# Altium schematic sheet Connector-Sheet.SchDoc
size 420 x 297 mm; SheetNumber: 4; SheetTotal: 4
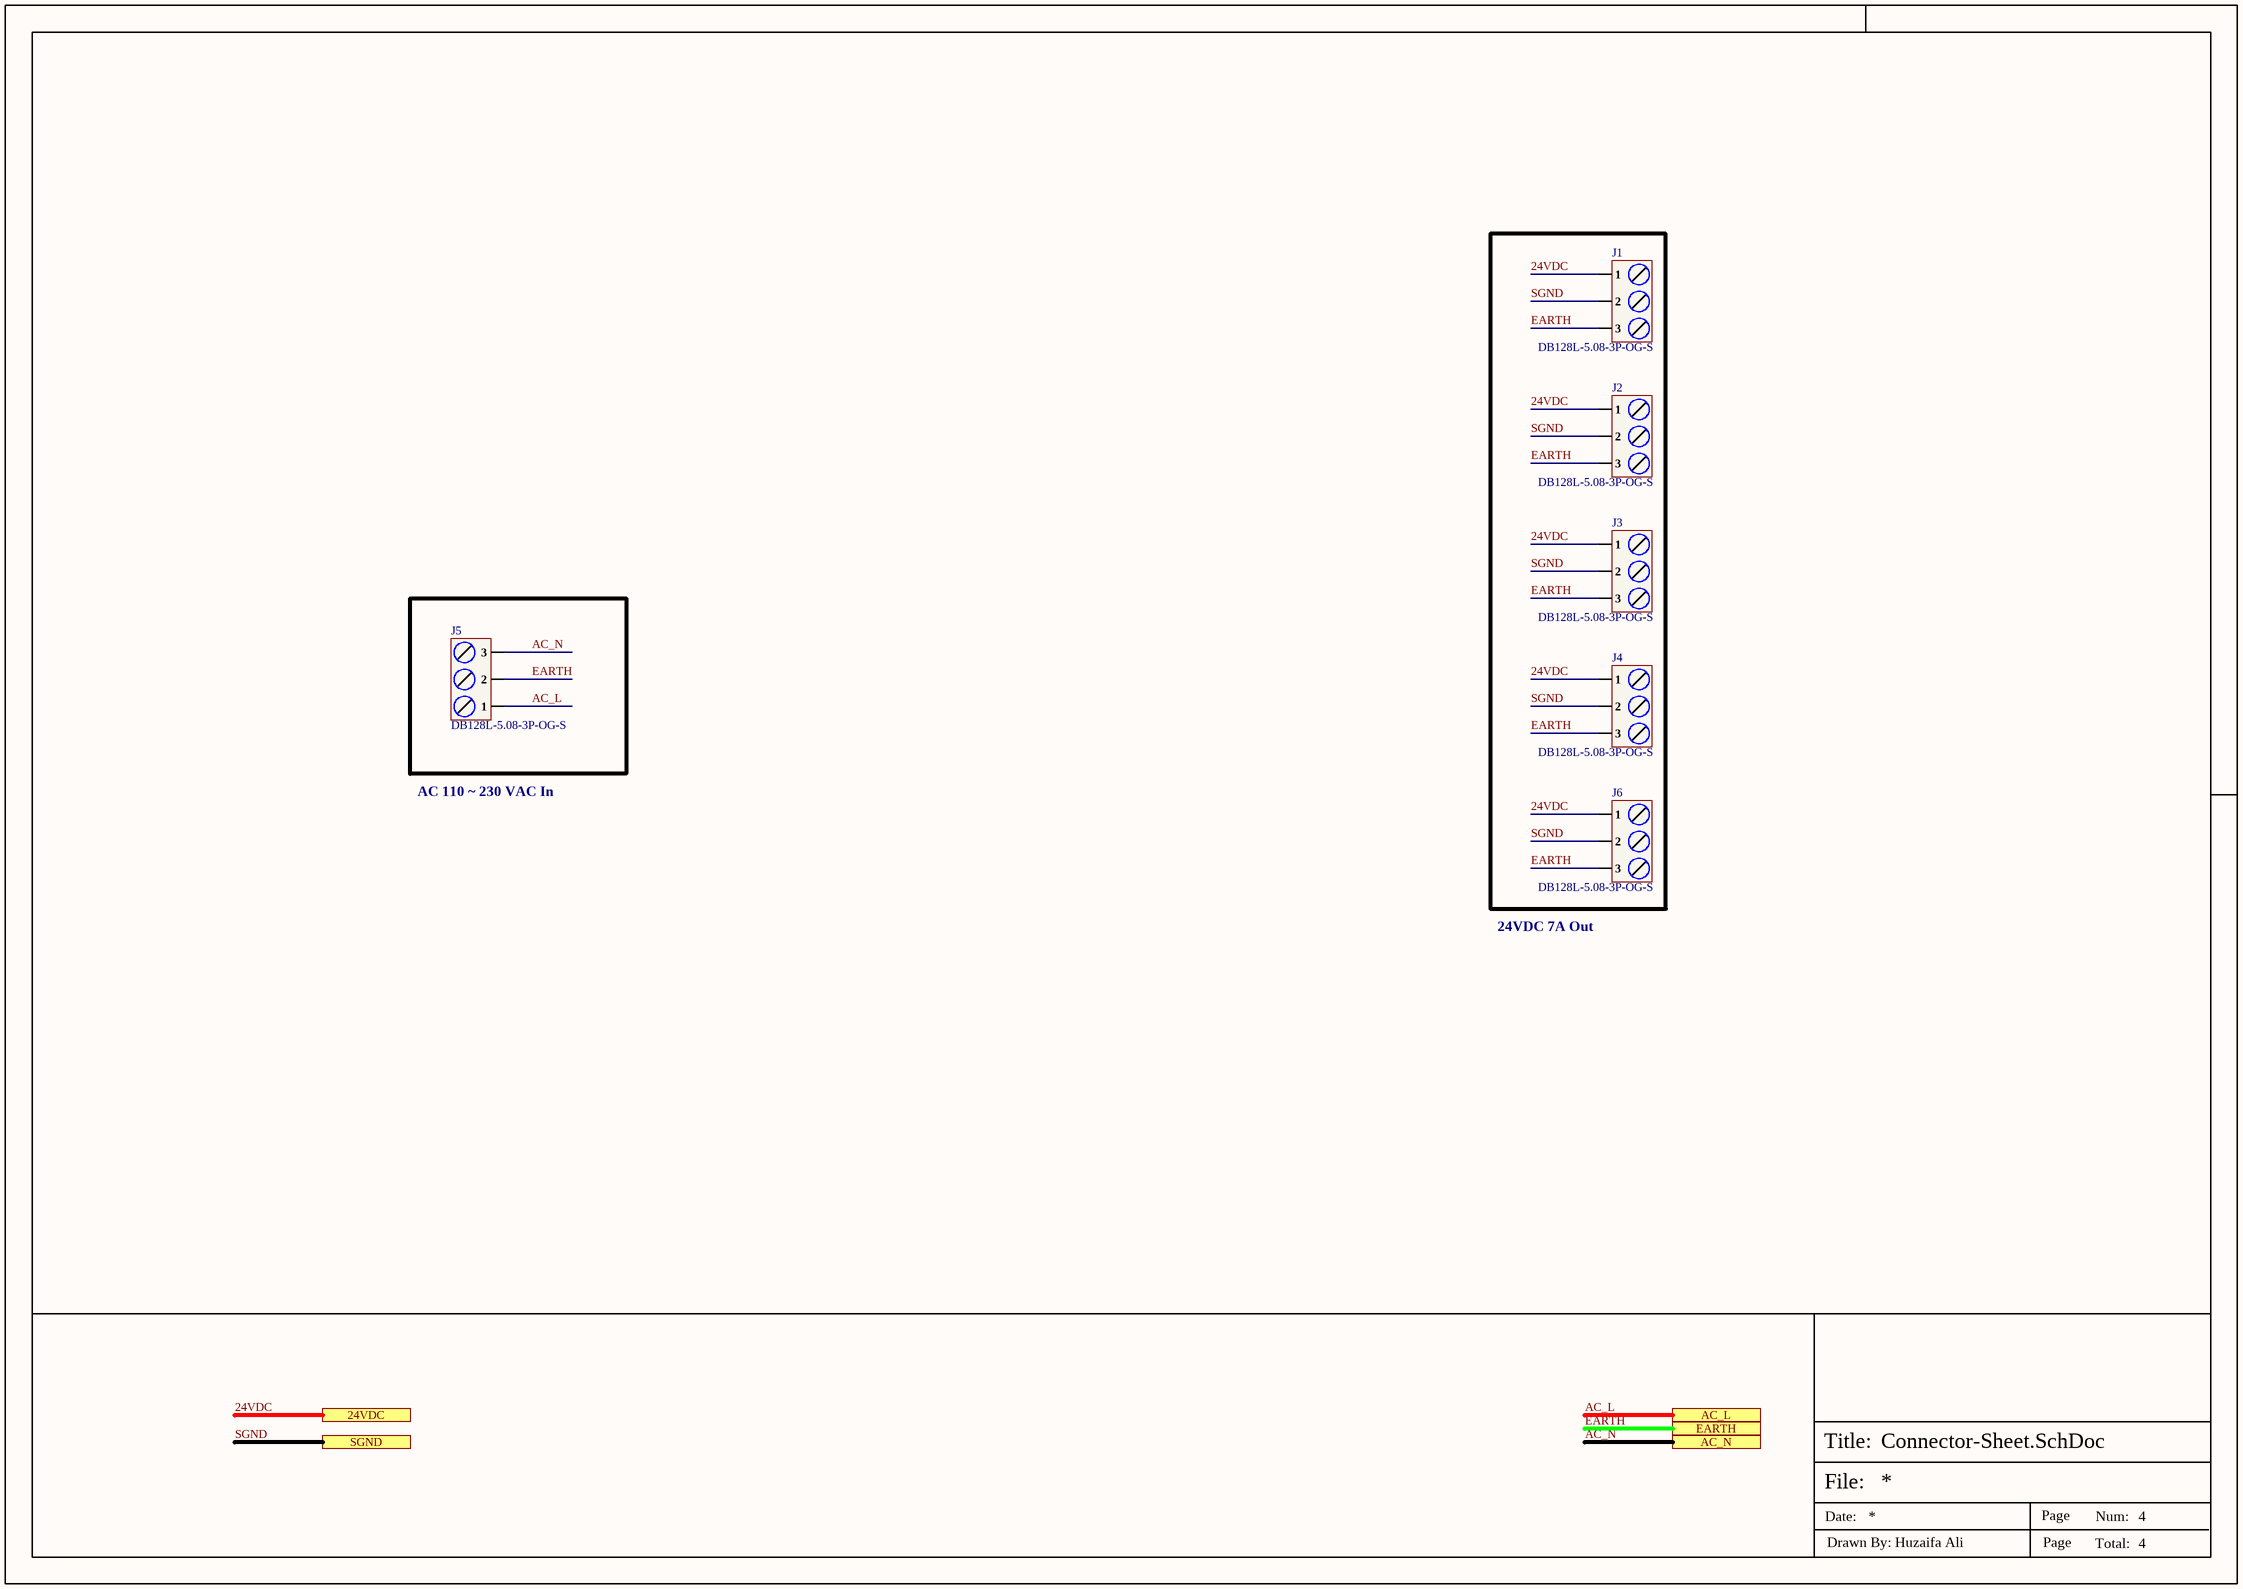
[diagram p0: Connector-Sheet.SchDoc]

## Parts
J1  DB128L-5.08-3P-OG-S  [DB128L-5.08-3P-OG-S]
J2  DB128L-5.08-3P-OG-S  [DB128L-5.08-3P-OG-S]
J3  DB128L-5.08-3P-OG-S  [DB128L-5.08-3P-OG-S]
J4  DB128L-5.08-3P-OG-S  [DB128L-5.08-3P-OG-S]
J5  DB128L-5.08-3P-OG-S  [DB128L-5.08-3P-OG-S]
J6  DB128L-5.08-3P-OG-S  [DB128L-5.08-3P-OG-S]

## Ports
24VDC (see Top-Sheet[3B], Power_Controller-Sheet[1D]), AC_L (see Top-Sheet[3B], PFC-Sheet[4D]), AC_N (see Top-Sheet[3B], PFC-Sheet[4D]), EARTH (see Top-Sheet[3B], PFC-Sheet[4D]), SGND (see Top-Sheet[3B], Power_Controller-Sheet[1D])

## Nets
24VDC: J1.1 J2.1 J3.1 J4.1 J6.1 ; port 24VDC
AC_L: J5.1 ; port AC_L
AC_N: J5.3 ; port AC_N
EARTH: J1.3 J2.3 J3.3 J4.3 J5.2 J6.3 ; port EARTH
SGND: J1.2 J2.2 J3.2 J4.2 J6.2 ; port SGND

## Notes on the sheet
- AC 110 ~ 230 VAC In
- 24VDC 7A Out
- File:
- Title:
- Date:
- Page
- Num:
- Total:
- Drawn By: Huzaifa Ali

## Library data of the parts
J1-J6 = DB128L-5.08-3P-OG-S: 1x3P 18A -40℃~+105℃ 250V Orange 12~30 Direct Insert 5.08mm 2.5 1 3 Plugin,P=5.08mm Screw Terminal Blocks ROHS; Manufacturer: DORABO; Manufacturer Part Number: DB128L-5.08-3P-OG-S; Package: Plugin,P=5.08mm; LCSC Part Number: C430604; Item Type: Terminal Block; ComponentLink1Description: LCSC; ComponentLink1URL: https://www.lcsc.com/product-detail/Screw-Terminal-Blocks_DORABO-DB128L-5-08-3P-OG-S_C430604.html